# Altium schematic sheet Top_Sheet.SchDoc
size A4; DocumentNumber: 1; SheetNumber: 1; SheetTotal: 6
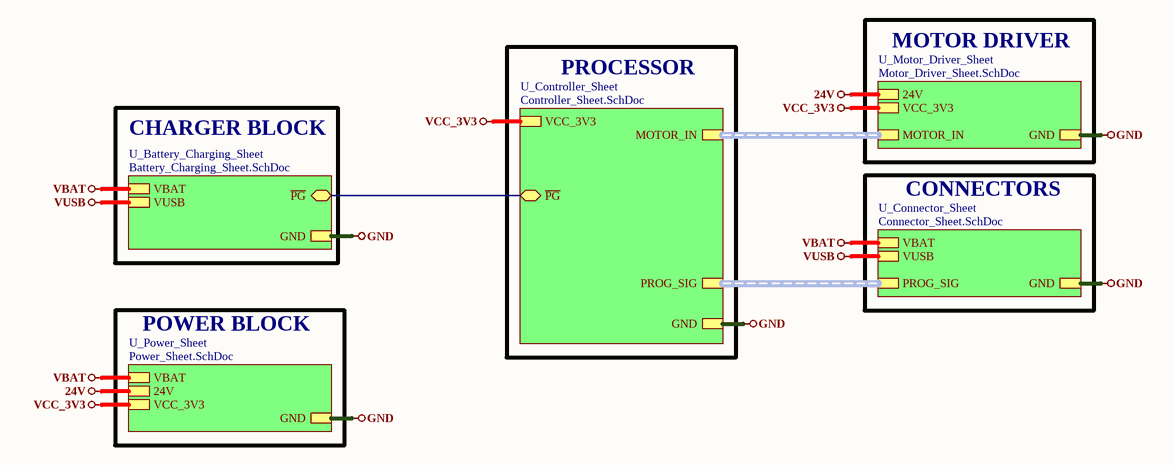
[diagram p0: Top_Sheet.SchDoc]

## Sub-sheets
U_Battery_Charging_Sheet = Battery_Charging_Sheet.SchDoc: ~{PG} (bidir), VBAT, GND, VUSB
U_Connector_Sheet = Connector_Sheet.SchDoc: VBAT, GND, VUSB, PROG_SIG (harness PROG_SIG)
U_Controller_Sheet = Controller_Sheet.SchDoc: ~{PG} (bidir), MOTOR_IN (harness MOTOR_IN), GND, VCC_3V3, PROG_SIG (harness PROG_SIG)
U_Motor_Driver_Sheet = Motor_Driver_Sheet.SchDoc: MOTOR_IN (harness MOTOR_IN), GND, 24V, VCC_3V3
U_Power_Sheet = Power_Sheet.SchDoc: VBAT, GND, 24V, VCC_3V3

## Nets
24V: sheet U_Motor_Driver_Sheet/24V, sheet U_Power_Sheet/24V
GND: sheet U_Battery_Charging_Sheet/GND, sheet U_Controller_Sheet/GND, sheet U_Motor_Driver_Sheet/GND, sheet U_Power_Sheet/GND, sheet U_Connector_Sheet/GND
VBAT: sheet U_Battery_Charging_Sheet/VBAT, sheet U_Power_Sheet/VBAT, sheet U_Connector_Sheet/VBAT
VCC_3V3: sheet U_Controller_Sheet/VCC_3V3, sheet U_Motor_Driver_Sheet/VCC_3V3, sheet U_Power_Sheet/VCC_3V3
VUSB: sheet U_Battery_Charging_Sheet/VUSB, sheet U_Connector_Sheet/VUSB
(unnamed): sheet U_Battery_Charging_Sheet/~{PG}, sheet U_Controller_Sheet/~{PG}

## Buses and harness runs
harness sheet U_Connector_Sheet/PROG_SIG = sheet U_Controller_Sheet/PROG_SIG
harness sheet U_Controller_Sheet/MOTOR_IN = sheet U_Motor_Driver_Sheet/MOTOR_IN

## Notes on the sheet
- PROCESSOR
- MOTOR DRIVER
- CHARGER BLOCK
- CONNECTORS
- POWER BLOCK
- 1
- Huzaifa Ali